# EAGLE schematic Placa 1.1 (EAGLE 9.7.0)
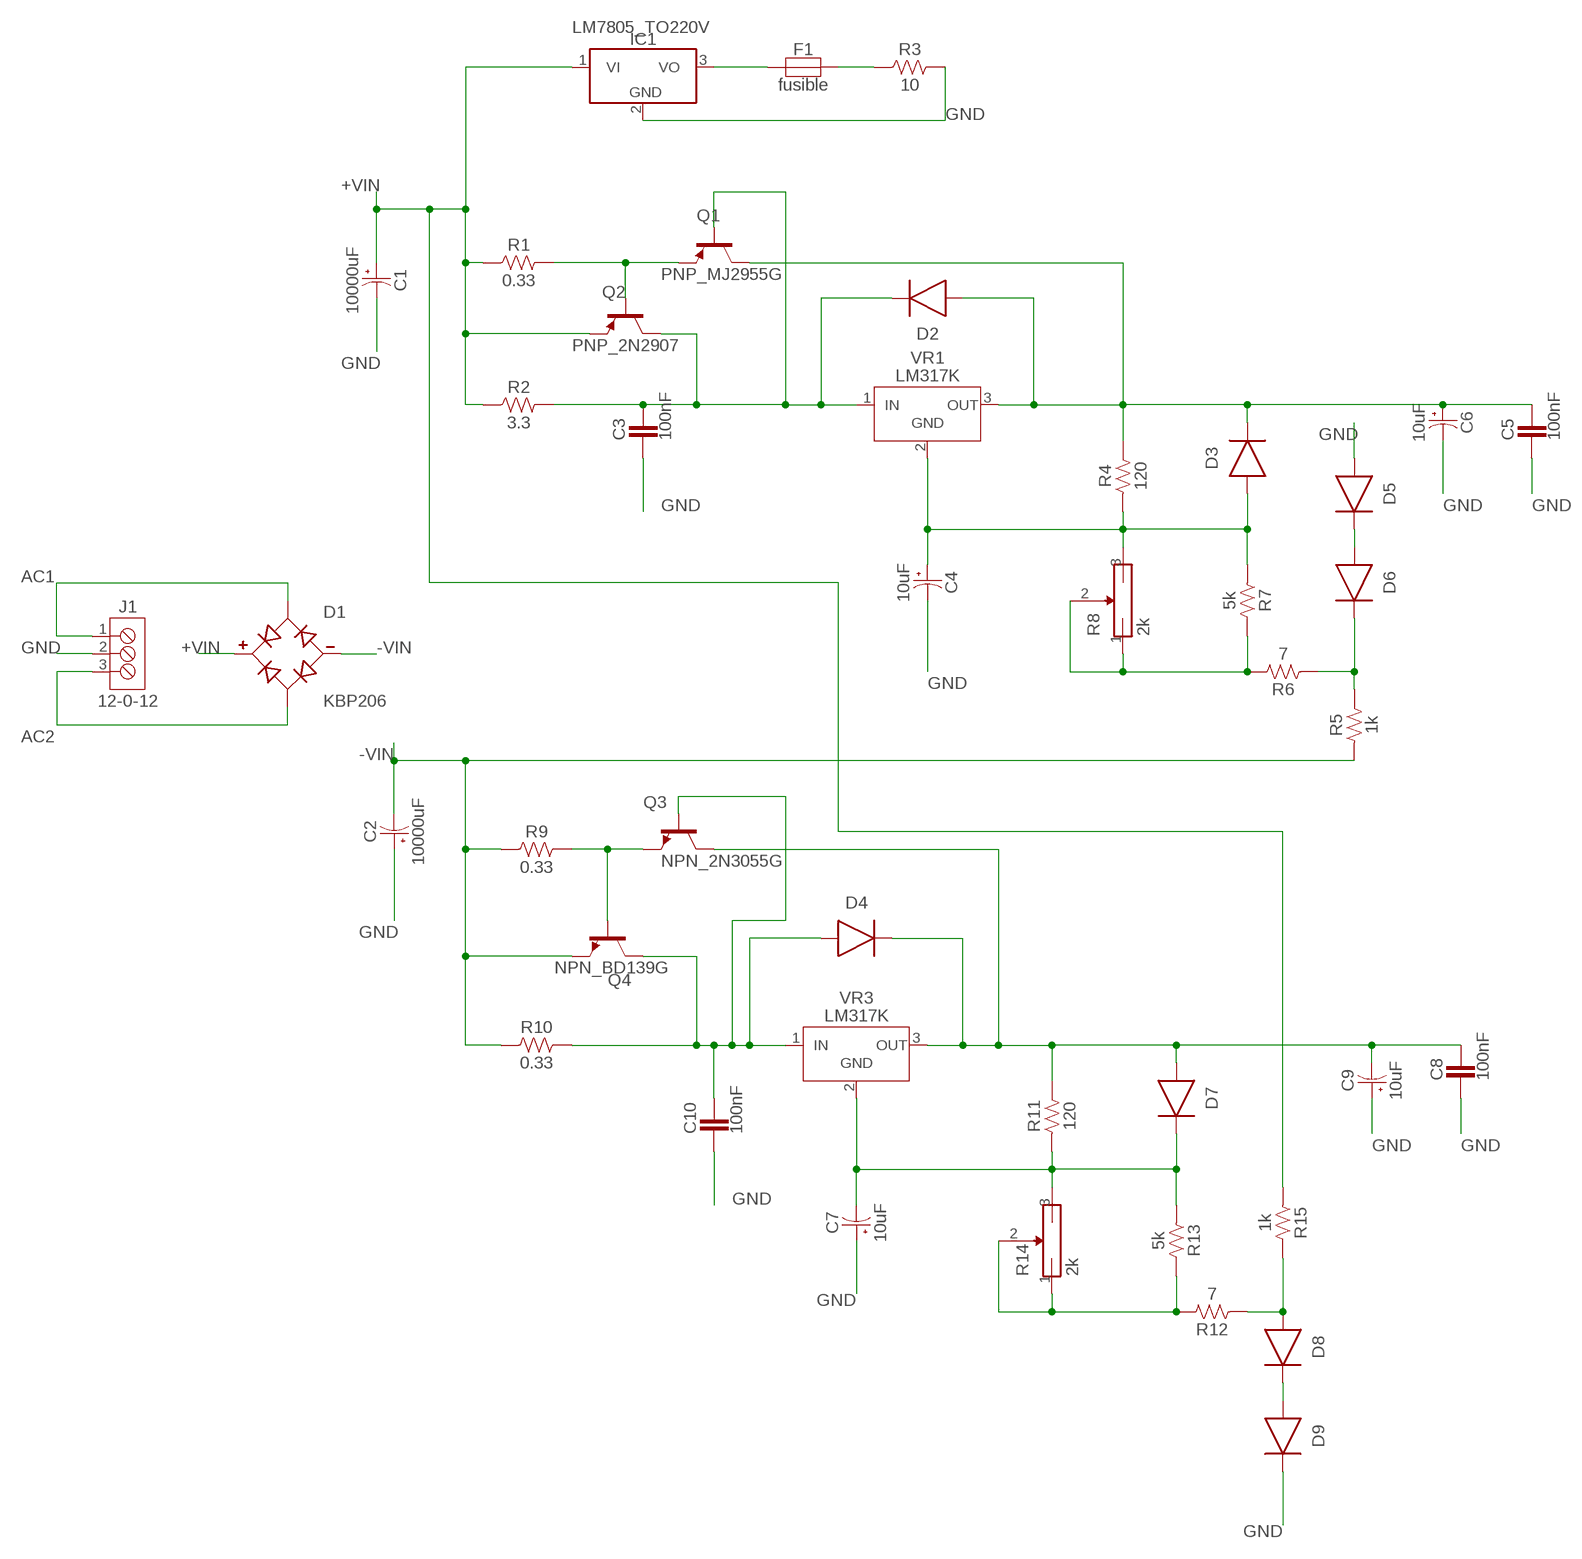
[diagram p0: schematic, sheet 1]

## Parts
C1  10000uF  C-POL-US_RADIAL-20MM-DIA  [CAPPRD550W60D1200H2000B]
C2  10000uF  C-POL-US_RADIAL-20MM-DIA  [CAPPRD550W60D1200H2000B]
C3  100nF  CAPACITORCERAMIC-2.54MM  [CAP-THRU-2.54MM]
C4  10uF  C-POL-USRADIAL-6.3MM-DIA  [CAPPRD250W80D630H800B]
C5  100nF  CAPACITORCERAMIC-2.54MM  [CAP-THRU-2.54MM]
C6  10uF  C-POL-USRADIAL-6.3MM-DIA  [CAPPRD250W80D630H800B]
C7  10uF  C-POL-USRADIAL-6.3MM-DIA  [CAPPRD250W80D630H800B]
C8  100nF  CAPACITORCERAMIC-2.54MM  [CAP-THRU-2.54MM]
C9  10uF  C-POL-USRADIAL-6.3MM-DIA  [CAPPRD250W80D630H800B]
C10  100nF  CAPACITORCERAMIC-2.54MM  [CAP-THRU-2.54MM]
D1  KBP206  [SIP380W81P386L1470H1270Q4]
D2  DIODEDIODE-AXIAL  [DIODE-AXIAL]
D3  DIODEDIODE-AXIAL  [DIODE-AXIAL]
D4  DIODEDIODE-AXIAL  [DIODE-AXIAL]
D5  DIODEDIODE-AXIAL  [DIODE-AXIAL]
D6  DIODEDIODE-AXIAL  [DIODE-AXIAL]
D7  DIODEDIODE-AXIAL  [DIODE-AXIAL]
D8  DIODEDIODE-AXIAL  [DIODE-AXIAL]
D9  DIODEDIODE-AXIAL  [DIODE-AXIAL]
F1  fusible  0213.200MXE  [FUSAD2590W70L2150D550B]
IC1  LM7805_TO220V  [TO220V]
J1  12-0-12  2828XX-3282837-3  [TERMBLK_508-3N]
Q1  PNP_MJ2955G  PNP_TO92-CBE  [TO92]
Q2  PNP_2N2907  PNP_TO92-CBE  [TO92]
Q3  NPN_2N3055G  NPN_TO92-EBC  [TO92]
Q4  NPN_BD139G  NPN_TO92-EBC  [TO92]
R1  0.33  R-US_AXIAL-7.2MM-PITCH  [RESAD724W46L381D178B]
R2  3.3  R-US_AXIAL-7.2MM-PITCH  [RESAD724W46L381D178B]
R3  10  R-US_AXIAL-7.2MM-PITCH  [RESAD724W46L381D178B]
R4  120  R-US_AXIAL-7.2MM-PITCH  [RESAD724W46L381D178B]
R5  1k  R-US_AXIAL-7.2MM-PITCH  [RESAD724W46L381D178B]
R6  7  R-US_AXIAL-7.2MM-PITCH  [RESAD724W46L381D178B]
R7  5k  R-US_AXIAL-7.2MM-PITCH  [RESAD724W46L381D178B]
R8  2k  POT-WH148-WH148-5.0  [WH148-5.0]
R9  0.33  R-US_AXIAL-7.2MM-PITCH  [RESAD724W46L381D178B]
R10  0.33  R-US_AXIAL-7.2MM-PITCH  [RESAD724W46L381D178B]
R11  120  R-US_AXIAL-7.2MM-PITCH  [RESAD724W46L381D178B]
R12  7  R-US_AXIAL-7.2MM-PITCH  [RESAD724W46L381D178B]
R13  5k  R-US_AXIAL-7.2MM-PITCH  [RESAD724W46L381D178B]
R14  2k  POT-WH148-WH148-5.0  [WH148-5.0]
R15  1k  R-US_AXIAL-7.2MM-PITCH  [RESAD724W46L381D178B]
VR1  LM317K  LM7805_TO220V  [TO220V]
VR3  LM317K  LM7805_TO220V  [TO220V]

## Nets
+VIN: C1.1(+) D1.1(+) IC1.1(VI) Q2.3(E) R1.1 R2.1 R15.1
-VIN: C2.2(-) D1.4(-) Q4.1(E) R5.1 R9.1 R10.1
AC1: D1.2(AC1) J1.1
AC2: D1.3(AC2) J1.3
GND: C1.2(-) C2.1(+) C3.2 C4.2(-) C5.2 C6.2(-) C7.1(+) C8.2 C9.1(+) C10.2 D5.1(A) D9.2(C) IC1.2(GND) J1.2 R3.2
N$1: C5.1 C6.1(+) D2.1(A) D3.2(C) Q1.1(C) R4.2 VR1.3(VO)
N$2: R6.2 R7.2 R8.1 R8.2(W)
N$3: Q1.3(E) Q2.2(B) R1.2
N$4: C3.1 D2.2(C) Q1.2(B) Q2.1(C) R2.2 VR1.1(VI)
N$5: C4.1(+) D3.1(A) R4.1 R7.1 R8.3 VR1.2(GND)
N$6: F1.1 IC1.3(VO)
N$7: D5.2(C) D6.1(A)
N$8: D6.2(C) R5.2 R6.1
N$9: F1.2 R3.1
N$10: Q3.1(E) Q4.2(B) R9.2
N$11: C8.1 C9.2(-) D4.2(C) D7.1(A) Q3.3(C) R11.2 VR3.3(VO)
N$12: C10.1 D4.1(A) Q3.2(B) Q4.3(C) R10.2 VR3.1(VI)
N$13: C7.2(-) D7.2(C) R11.1 R13.1 R14.3 VR3.2(GND)
N$14: R12.2 R13.2 R14.1 R14.2(W)
N$15: D8.2(C) D9.1(A)
N$18: D8.1(A) R12.1 R15.2

## Library data of the parts
C1 C2 = Capacitor:C-POL-US: Capacitor Polarised - ANSI; CATEGORY_L1: Capacitor; CATEGORY_L2: Aluminum Electrolytic Capacitors; CATEGORY_L3: Radial Can; PACKAGE: Through Hole; PACKAGE_SIZE: 20MM-DIA
C3 C5 C8 C10 = Tinkercad:CAPACITOR: Capacitor - Generic
C4 C6 C7 C9 = Capacitor:C-POL-US: Capacitor Polarised - ANSI; CATEGORY_L1: Capacitor; CATEGORY_L2: Aluminum Electrolytic Capacitors; CATEGORY_L3: Radial Can; DESCRIPTION: Radial Polarized Capacitor, 0.098" (2.50mm) pitch, 0.248" Dia (6.30mm) body diameter, 0.315" (8.00mm) body height; PACKAGE: Through Hole
D1 = KBP206_RECTIFICADOR:KBP206: Check availability <https://pricing.snapeda.com/parts/KBP206/GeneSiC%20Semiconductor/view-part?ref=eda>; AVAILABILITY: In Stock; CHECK_PRICES: https://www.snapeda.com/parts/KBP206/GeneSiC+Semiconductor/view-part/?ref=eda; DESCRIPTION: Bridge Rectifier Single Phase Standard 600 V Through Hole KBP; MF: GeneSiC Semiconductor; MP: KBP206; PACKAGE: SIP-4 GeneSiC Semiconductor; PRICE: None; SNAPEDA_LINK: https://www.snapeda.com/parts/KBP206/GeneSiC+Semiconductor/view-part/?ref=snap
D2-D9 = Tinkercad:DIODE: Diode Rectifier - Generic
F1 = Fuse:0213*?: Littelfuse Inc. 213 Series Fuses; CATEGORY_L1: Circuit Protection; CATEGORY_L2: Fuses; CATEGORY_L3: Cartridge, Glass; CATEGORY_L4: Slow Blow; DESCRIPTION: FUSE GLASS 200MA 250VAC 5X20MM; HOLD_CURRENT: 200 mA; MANUFACTURER: Littelfuse Inc.; MAXTEMP: 125 C; MPN: 0213.200MXE; OPERATING_TEMPERATURE: -55°C ~ 125°C; PACKAGE: Through Hole; PACKAGE_SIZE: 5mm x 20mm (Axial); PART_STATUS: Obsolete; ROHS: Compliant; SERIES: 213; TRIP_CURRENT: 35A; VENDOR: Digikey; VPN: 0213.200MXE-ND
IC1 = Tinkercad:LM7805: 5V Voltage Regulator Reference Datasheet <https://www.ti.com/lit/ds/symlink/lm340.pdf>
J1 = Connector:2828XX-3: 3 Position Wire to Board Terminal Block Horizontal with Board; CATEGORY_L1: Connectors; CATEGORY_L2: Terminal Block; CATEGORY_L3: Screw Terminal - Rising Cage Clamp Side Wire Entry; DATASHEET: https://www.te.com/usa-en/product-282837-3.datasheet.pdf; DESCRIPTION: 3 Position Wire to Board Terminal Block Horizontal with Board 0.200" (5.08mm) Through Hole; MANUFACTURER: TE Connectivity AMP Connectors; MPN: 282837-3; OPERATING_TEMPERATURE: -40°C ~ 105°C; PACKAGE: Through Hole; PACKAGE_SIZE: NA; PART_STATUS: Active; PITCH: 0.200" (5.08mm); ROHS: Compliant; SERIES: Buchanan
Q1 Q2 = Transistor:PNP: PNP Transistor - Generic; CATEGORY_L1: Transistor; CATEGORY_L2: BJT; CATEGORY_L3: PNP; DATASHEET: https://www.analog.com/media/en/package-pcb-resources/package/pkg_pdf/to-92t/T-3-1.pdf; DESCRIPTION: Generic NPN Transistor through Hole TO92-CBE Package; PACKAGE: Through Hole; PACKAGE_SIZE: TO92
Q3 Q4 = Transistor:NPN: NPN Transistor - Generic; CATEGORY_L1: Transistor; CATEGORY_L2: BJT; CATEGORY_L3: NPN; DATASHEET: https://www.analog.com/media/en/package-pcb-resources/package/pkg_pdf/to-92t/T-3-1.pdf; DESCRIPTION: Generic NPN Transistor through Hole TO92-EBC Package; PACKAGE: Through Hole; PACKAGE_SIZE: TO92
R1-R7 R9-R13 R15 = Resistor:R-US: Resistor Fixed - ANSI; CATEGORY_L1: Resistors; DESCRIPTION: Axial Resistor 7.24 mm pitch 3.81 mm body length 1.78 mm body diameter; PACKAGE: Through Hole; PACKAGE_SIZE: Axial
R8 R14 = Potenciometro_WH148:POT-WH148: Potenciometro rotativo 16 mm, 3 terminales (WH148 / RV16). Pin 1 = extremo, W = cursor, 3 = extremo. Para LM317: puentea W con 1 (o con 3) y el otro extremo a GND.
VR1 VR3 = Mis_Componentes:LM7805: 5V Voltage Regulator Reference Datasheet <https://www.ti.com/lit/ds/symlink/lm340.pdf>; CATEGORY_L1: Power Management IC; CATEGORY_L2: Voltage Regulators; CATEGORY_L3: Linear & LDO Regulators; DESCRIPTION: Linear Voltage Regulator IC TO-220; PACKAGE: Through Hole; PACKAGE_SIZE: TO-220; SERIES: LM7805